# Altium schematic sheet RS232-Sheet.SchDoc
size 420 x 297 mm; SheetNumber: 11; SheetTotal: 15
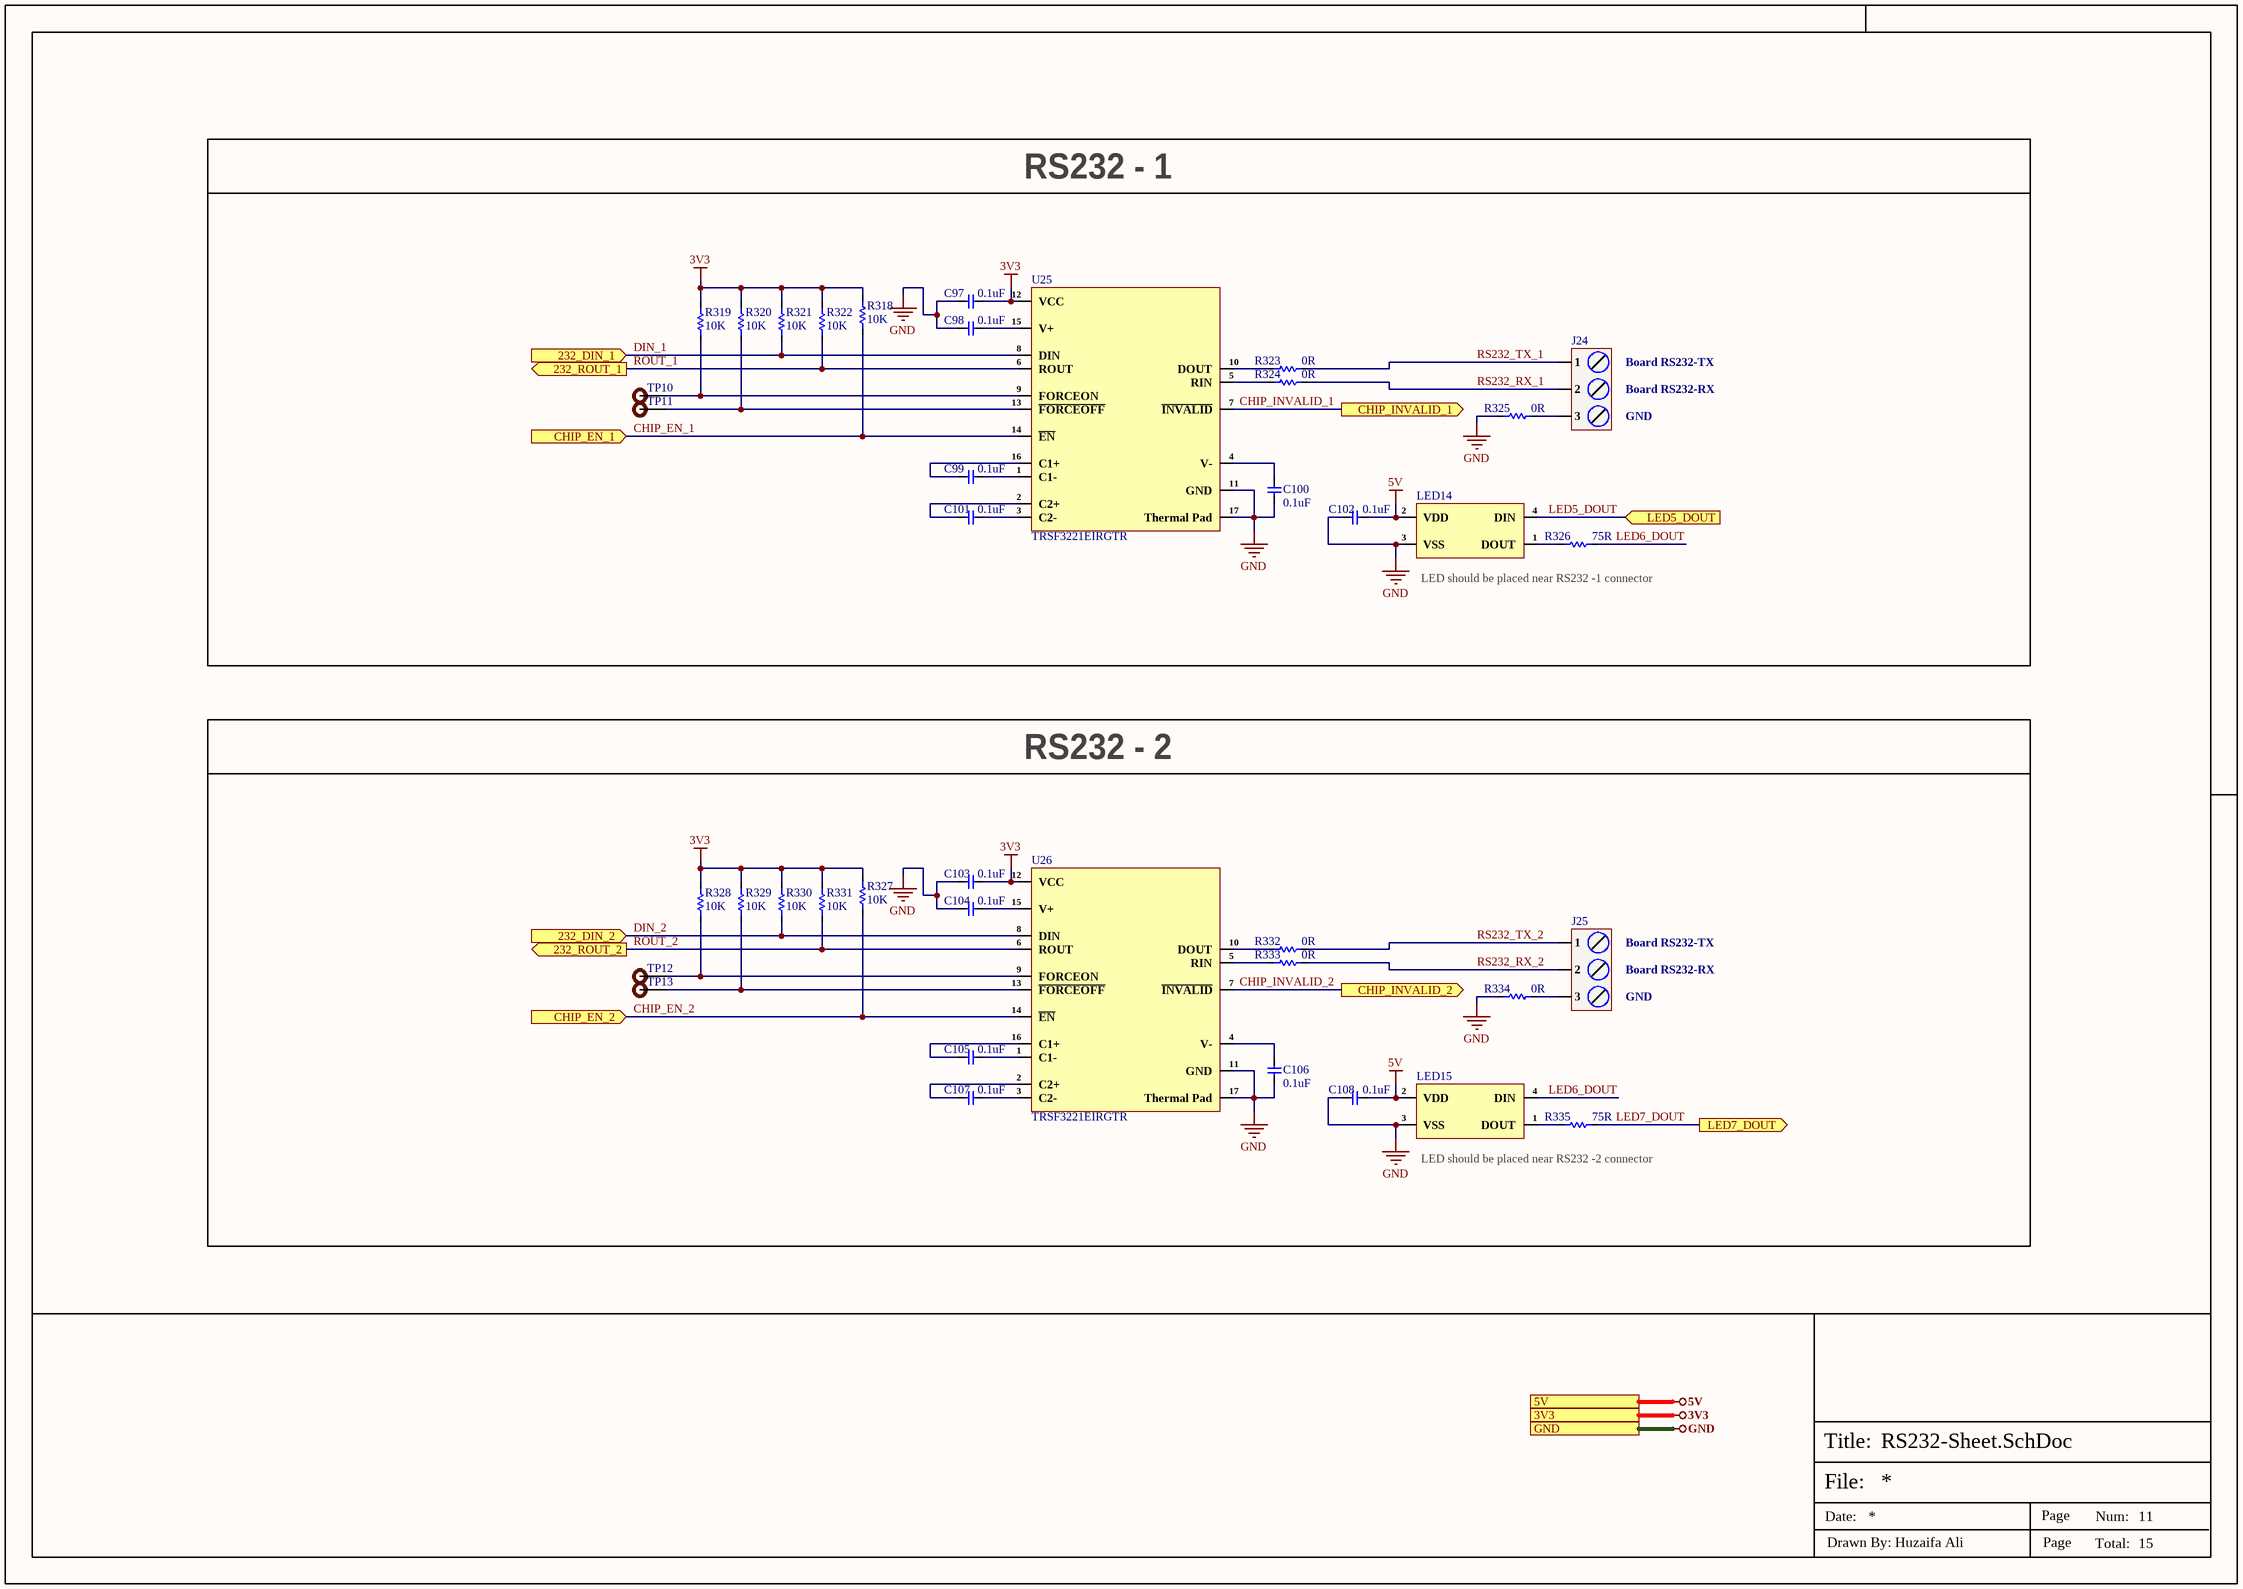
[diagram p0: RS232-Sheet.SchDoc]

## Parts
C97  0.1uF  [Cap-0402]
C98  0.1uF  [Cap-0402]
C99  0.1uF  [Cap-0402]
C100  0.1uF  [Cap-0402]
C101  0.1uF  [Cap-0402]
C102  0.1uF  [Cap-0402]
C103  0.1uF  [Cap-0402]
C104  0.1uF  [Cap-0402]
C105  0.1uF  [Cap-0402]
C106  0.1uF  [Cap-0402]
C107  0.1uF  [Cap-0402]
C108  0.1uF  [Cap-0402]
J24  DB128L-5.08-3P-GN-S  [DB128L-5.08-3P-GN-S]  (value not drawn)
J25  DB128L-5.08-3P-GN-S  [DB128L-5.08-3P-GN-S]  (value not drawn)
LED14  WS2812D-F5  [WS2812D-F5]  (value not drawn)
LED15  WS2812D-F5  [WS2812D-F5]  (value not drawn)
R318  10K  [Res-0402]
R319  10K  [Res-0402]
R320  10K  [Res-0402]
R321  10K  [Res-0402]
R322  10K  [Res-0402]
R323  0R  [Res-0402]
R324  0R  [Res-0402]
R325  0R  [Res-0402]
R326  75R  [Res-0402]
R327  10K  [Res-0402]
R328  10K  [Res-0402]
R329  10K  [Res-0402]
R330  10K  [Res-0402]
R331  10K  [Res-0402]
R332  0R  [Res-0402]
R333  0R  [Res-0402]
R334  0R  [Res-0402]
R335  75R  [Res-0402]
TP10  TEST POINT  [Test-point]  (value not drawn)  (no BOM)
TP11  TEST POINT  [Test-point]  (value not drawn)  (no BOM)
TP12  TEST POINT  [Test-point]  (value not drawn)  (no BOM)
TP13  TEST POINT  [Test-point]  (value not drawn)  (no BOM)
U25  TRSF3221EIRGTR  [16-QFN (3x3).]
U26  TRSF3221EIRGTR  [16-QFN (3x3).]

## Blocks framed on the sheet
RS232 - 1: C97-C102 J24 LED14 R318-R326 TP10 TP11 U25
RS232 - 2: C103-C108 J25 LED15 R327-R335 TP12 TP13 U26

## Ports
3V3 (see Top-Sheet[5B], CAN-Sheet[5D], Controller-Sheet-1[4D], Controller-Sheet-2[4D], Controller-Sheet-3[4D], DIOs-Lights-Sensors-Sheet[4D], Display-Sheet[5D], ESP32_Sheet[6D], EtherCAT-Sheet[1D], Ethernet-Sheet[5D], Power-Sheet[4D], RS485-Sheet[5D], STM32-USB-Sheet[4D]), 5V (see Top-Sheet[5B], Analog-AIO-Sheet[5D], CAN-Sheet[5D], Controller-Sheet-2[4D], Controller-Sheet-3[4D], DIOs-Lights-Sensors-Sheet[4D], Display-Sheet[5D], Power-Sheet[4D], RS485-Sheet[5D], STM32-USB-Sheet[4D]), 232_DIN_1 (in, see Top-Sheet[5B]), 232_DIN_2 (in, see Top-Sheet[5B]), 232_ROUT_1 (out, see Top-Sheet[5B]), 232_ROUT_2 (out, see Top-Sheet[5B]), CHIP_EN_1 (in, see Top-Sheet[5B]), CHIP_EN_2 (in, see Top-Sheet[5B]), CHIP_INVALID_1 (out, see Top-Sheet[5B]), CHIP_INVALID_2 (out, see Top-Sheet[5B]), GND (see Top-Sheet[5B], Analog-AIO-Sheet[5D], CAN-Sheet[6D], Controller-Sheet-1[4D], Controller-Sheet-2[4D], Controller-Sheet-3[4D], DIOs-Lights-Sensors-Sheet[4D], Display-Sheet[5D], ESP32_Sheet[6D], EtherCAT-Sheet[1D], Ethernet-Sheet[5D], Power-Sheet[4D], RS485-Sheet[5D], STM32-USB-Sheet[4D]), LED5_DOUT (in, see Top-Sheet[5B], CAN-Sheet[5D]), LED7_DOUT (out, see Top-Sheet[5B], RS485-Sheet[5A])

## Nets
3V3: C97.1 C103.1 R318.1 R319.1 R320.1 R321.1 R322.1 R327.1 R328.1 R329.1 R330.1 R331.1 U25.12(VCC) U26.12(VCC) ; port 3V3
5V: C102.2 C108.2 LED14.2(VDD) LED15.2(VDD) ; port 5V
GND: C97.2 C98.2 C100.2 C102.1 C103.2 C104.2 C106.2 C108.1 LED14.3(VSS) LED15.3(VSS) R325.1 R334.1 U25.11(GND) U25.17(Thermal_Pad) U26.11(GND) U26.17(Thermal_Pad) ; port GND
CHIP_EN_1: R318.2 U25.14(~{EN}) ; port CHIP_EN_1
CHIP_EN_2: R327.2 U26.14(~{EN}) ; port CHIP_EN_2
CHIP_INVALID_1: U25.7(~{INVALID}) ; port CHIP_INVALID_1
CHIP_INVALID_2: U26.7(~{INVALID}) ; port CHIP_INVALID_2
DIN_1: R321.2 U25.8(DIN) ; port 232_DIN_1
DIN_2: R330.2 U26.8(DIN) ; port 232_DIN_2
LED5_DOUT: LED14.4(DIN) ; port LED5_DOUT
LED6_DOUT: LED15.4(DIN) R326.2
LED7_DOUT: R335.2 ; port LED7_DOUT
ROUT_1: R322.2 U25.6(ROUT) ; port 232_ROUT_1
ROUT_2: R331.2 U26.6(ROUT) ; port 232_ROUT_2
RS232_RX_1: J24.2 R324.1
RS232_RX_2: J25.2 R333.1
RS232_TX_1: J24.1 R323.1
RS232_TX_2: J25.1 R332.1
NetC98_1: C98.1 U25.15(V+)
NetC99_1: C99.1 U25.1(C1-)
NetC99_2: C99.2 U25.16(C1+)
NetC100_1: C100.1 U25.4(V-)
NetC101_1: C101.1 U25.3(C2-)
NetC101_2: C101.2 U25.2(C2+)
NetC104_1: C104.1 U26.15(V+)
NetC105_1: C105.1 U26.1(C1-)
NetC105_2: C105.2 U26.16(C1+)
NetC106_1: C106.1 U26.4(V-)
NetC107_1: C107.1 U26.3(C2-)
NetC107_2: C107.2 U26.2(C2+)
NetJ24_3: J24.3 R325.2
NetJ25_3: J25.3 R334.2
NetLED14_1: LED14.1(DOUT) R326.1
NetLED15_1: LED15.1(DOUT) R335.1
NetR319_2: R319.2 TP10.1 U25.9(FORCEON)
NetR320_2: R320.2 TP11.1 U25.13(~{FORCEOFF})
NetR323_2: R323.2 U25.10(DOUT)
NetR324_2: R324.2 U25.5(RIN)
NetR328_2: R328.2 TP12.1 U26.9(FORCEON)
NetR329_2: R329.2 TP13.1 U26.13(~{FORCEOFF})
NetR332_2: R332.2 U26.10(DOUT)
NetR333_2: R333.2 U26.5(RIN)

## Notes on the sheet
- Board RS232-TX
- Board RS232-RX
- GND
- LED should be placed near RS232 -1 connector
- LED should be placed near RS232 -2 connector
- File:
- Title:
- Date:
- Page
- Num:
- Total:
- Drawn By: Huzaifa Ali

## Library data of the parts
C97-C108 = CC0402JRX7R7BB104: CAP CER 0.1UF 16V X7R 0402; Manufacturer: Yageo; Material: 4241ConductorMaterial; Value: 100nF; Tolerance: 5%; Item Type: Capacitor; Supplier: Digikey; Supplier Part Number: 311-1676-1-ND; Manufacturer Part Number: CC0402JRX7R7BB104; RoHS: Yes; Category: Ceramic Capacitors; Stock: 1659111; Pricing: 1=0.1, 10=0.046, 50=0.0262, 100=0.0203, 500=0.01528, 1000=0.012, 2500=0.01091, 5000=0.01004 (USD); Mounting Technology: Surface Mount; Case/Package: 0402; Case Code (Metric): 1005; Case Code (Imperial): 0402; Min Operating Temperature: -55°C; Max Operating Temperature: 125°C; Dielectric: X7R; Packaging: Tape and Reel; Package Quantity: 10000; Voltage Rating (DC): 16V; Voltage Rating: 16V; Series: CC; Construction: Flat; Length: 0.039inch; Width: 0.02inch; Height: 0.5mm; Thickness: 0.022inch; Lead Free: Lead Free; Halogen Free: Halogen Free; RoHS Compliant: Yes; ComponentLink1URL: https://datasheet.ciiva.com/13210/upy-gphc-x7r-6-3v-to-50v-8-12304-13210152.pdf?src-supplier=Mouser; ComponentLink1Description: https://datasheet.ciiva.com/13210/upy-gphc-x7r-6-3v-to-50v-8-12304-13210152.pdf?src-supplier=Mouser; LCSC Part Number: C541464
J24 J25 = DB128L-5.08-3P-GN-S: 1x3P 18A -40℃~+105℃ 250V Green 12~30 Direct Insert 5.08mm 2.5 1 3 Plugin,P=5.08mm Screw Terminal Blocks ROHS; Manufacturer: DORABO; Manufacturer Part Number: DB128L-5.08-3P-GN-S; Package: Plugin,P=5.08mm; LCSC Part Number: C395869; Item Type: Terminal Block; ComponentLink1Description: LCSC; ComponentLink1URL: https://www.lcsc.com/product-detail/Screw-Terminal-Blocks_DORABO-DB128L-5-08-3P-GN-S_C395869.html
LED14 LED15 = WS2812D-F5: Plugin,D=5mm RGB LEDs ROHS; Manufacturer: Worldsemi; Item Type: RGB LED; Manufacturer Part Number: WS2812D-F5; Package: Plugin,D=5mm; LCSC Part Number: C190565; ComponentLink1Description: LCSC; ComponentLink1URL: https://jlcpcb.com/partdetail/Worldsemi-WS2812DF5/C190565
R318-R322 R327-R331 = RC0402FR-0710KL: RES 10K OHM 1% 1/16W 0402; Manufacturer: Yageo; Resistance: 10kR; Voltage Rating (DC): 50V; Temperature Coefficient: 100ppm/°C; Power Rating: 62.5mW; Max Power Dissipation: 63mW; Item Type: Resistor; Supplier 1: Mouser; Manufacturer Part Number: RC0402FR-0710KL; RoHS: Yes; Category: Chip SMD Resistors; Stock 1: 18648329; Pricing 1: 1=0.10000, 10=0.01400, 50=0.01400, 100=0.00500, 1000=0.00300, 10000=0.00200 (USD); Case/Package: 0402; Number of Pins: 2; Case Code (Imperial): 0402; Case Code (Metric): 1005; Min Operating Temperature: -55°C; Max Operating Temperature: 155°C; Resistor Type: Thick Film; Tolerance: 1%; Packaging: Tape and Reel; Voltage Rating: 50V; Termination: SMD/SMT; Working Voltage: 50V; Number of Terminations: 2; Features: Moisture Resistant; Series: RC; Resistance Tolerance: 1%; Construction: Rectangular; Length: 1mm; Width: 0.5mm; Height: 0.32mm; Depth: 0.5mm; Lead Pitch: 0.2mm; REACH SVHC: No SVHC; Lead Free: Lead Free; RoHS Compliant: Yes; Military Standard: Not; ComponentLink1URL: https://datasheet.ciiva.com/7660/38568-7660787.pdf?src-supplier=Element14; ComponentLink1Description: https://datasheet.ciiva.com/7660/38568-7660787.pdf?src-supplier=Element14; ComponentLink2URL: https://datasheet.ciiva.com/7849/1686128-7849814.pdf?src-supplier=Element14; ComponentLink2Description: https://datasheet.ciiva.com/7849/1686128-7849814.pdf?src-supplier=Element14; ComponentLink3URL: https://datasheet.ciiva.com/7983/1018594-7983486.pdf?src-supplier=Element14; ComponentLink3Description: https://datasheet.ciiva.com/7983/1018594-7983486.pdf?src-supplier=Element14; ComponentLink4URL: https://datasheet.ciiva.com/22747/1018594-22747512.pdf?src-supplier=Element14; ComponentLink4Description: https://datasheet.ciiva.com/22747/1018594-22747512.pdf?src-supplier=Element14; ComponentLink5URL: https://datasheet.ciiva.com/12667/pyu-rc0402-51-rohs-l-6-r-12667067.pdf?src-supplier=Mouser; ComponentLink5Description: https://datasheet.ciiva.com/12667/pyu-rc0402-51-rohs-l-6-r-12667067.pdf?src-supplier=Mouser; ComponentLink6URL: https://datasheet.ciiva.com/7849/1784430-7849813.pdf?src-supplier=Element14; ComponentLink6Description: https://datasheet.ciiva.com/7849/1784430-7849813.pdf?src-supplier=Element14; ComponentLink7URL: https://datasheet.ciiva.com/7849/1784430-7849815.pdf?src-supplier=Element14; ComponentLink7Description: https://datasheet.ciiva.com/7849/1784430-7849815.pdf?src-supplier=Element14; Supplier Part Number 1: 603-RC0402FR-0710KL; LCSC Part Number: C60490
R323-R325 R332-R334 = RC0402FR-070RL: RES 0 OHM JUMPER 1/16W 0402; Manufacturer: Yageo; Item Type: Resistors; Tolerance: 1%; Power Rating: 62.5mW; Voltage Rating: 50V; Temperature Coefficient: 200ppm/°C; Max Power Dissipation: 63mW; Supplier 1: Mouser; Manufacturer Part Number: RC0402FR-070RL; RoHS: Yes; Stock 1: 8556842; Pricing 1: 1=0.10000, 10=0.01400, 50=0.01400, 100=0.00600, 1000=0.00300, 5000=0.00200, 10000=0.00100 (USD); Mount: Surface Mount; Case/Package: 0402; Contact Plating: Tin,Matte; Case Code (Imperial): 0402; Case Code (Metric): 1005; Size Code: 0402; Min Operating Temperature: -55°C; Max Operating Temperature: 155°C; Resistance: 0R; Resistor Type: Thick Film; Packaging: Tape and Reel; Termination: SMD/SMT; Features: Moisture Resistant; Series: RC; Number of Terminations: 2; Length: 1mm; Width: 0.5mm; Height: 0.35mm; Radiation Hardening: No; Lead Free: Lead Free; RoHS Compliant: Yes; ComponentLink1URL: https://datasheet.ciiva.com/8896/pyu-rc0402-51-rohs-l-6-8896149.pdf?src-supplier=Avnet; ComponentLink1Description: https://datasheet.ciiva.com/8896/pyu-rc0402-51-rohs-l-6-8896149.pdf?src-supplier=Avnet; ComponentLink2URL: https://datasheet.ciiva.com/16790/pyu-rc0402-51-rohs-l-6-r-16790444.pdf?src-supplier=Future+Electronics; ComponentLink2Description: https://datasheet.ciiva.com/16790/pyu-rc0402-51-rohs-l-6-r-16790444.pdf?src-supplier=Future+Electronics; Supplier Part Number 1: 603-RC0402FR-070RL; LCSC Part Number: C106231
R326 R335 = RC0402JR-0775RL: RES 75 OHM 5% 1/16W 0402; Manufacturer: Yageo; Item Type: Resistor; Temperature Coefficient: 100ppm/°C; Power Rating: 62.5mW; Voltage Rating: 50V; Max Power Dissipation: 63mW; Supplier: Digikey; Supplier Part Number: 311-75JRCT-ND; Manufacturer Part Number: RC0402JR-0775RL; RoHS: Yes; Stock: 2993323; Pricing: 1=0.1, 10=0.018, 50=0.0102, 100=0.0083, 500=0.00528, 1000=0.00444, 5000=0.00307 (USD); Case/Package: 0402; Pins: 2; Contact Plating: Tin,Lead; Case Code (Imperial): 0402; Case Code (Metric): 1005; Min Operating Temperature: -55°C; Max Operating Temperature: 155°C; Value: 75R; Tolerance: 5%; Resistor Type: Thick Film; Packaging: Tape and Reel; Termination: SMD/SMT; Voltage Rating (DC): 50V; Features: Moisture Resistant; Series: RC; Number of Terminations: 2; Resistance Tolerance: 5%; Length: 1mm; Width: 0.5mm; Height: 0.35mm; Reach SVHC Compliant: No; Lead Free: Lead Free; RoHS Compliant: Yes; ComponentLink1URL: https://datasheet.ciiva.com/7983/1018594-7983612.pdf?src-supplier=Element14; ComponentLink1Description: https://datasheet.ciiva.com/7983/1018594-7983612.pdf?src-supplier=Element14; ComponentLink2URL: https://datasheet.ciiva.com/17082/pyu-rc0402-51-rohs-l-6-r-17082239.pdf?src-supplier=Future+Electronics; ComponentLink2Description: https://datasheet.ciiva.com/17082/pyu-rc0402-51-rohs-l-6-r-17082239.pdf?src-supplier=Future+Electronics; LCSC Part Number: C137841
TP10-TP13 = TEST POINT: Test Point ON; Item Type: TEST POINT
U25 U26 = TRSF3221EIRGTR: IC TRANSCEIVER FULL 1/1 16VQFN; Manufacturer: Texas Instruments; Supplier: Mouser; LCSC Part Number: C2861230; Manufacturer Part Number: TRSF3221EIRGTR; RoHS: No; Item Type: IC; Stock: 8746; Pricing: 1=2.41, 10=1.64, 50=1.64, 100=1.47, 1000=1.3, 10000=1.24 (USD)